# Altium project Carrier-Board-v1.0.PrjPcb (part 4 of 9)

## Sheet USB3.0_INTERFACE.SchDoc
size A4; SheetNumber: 7; SheetTotal: 20
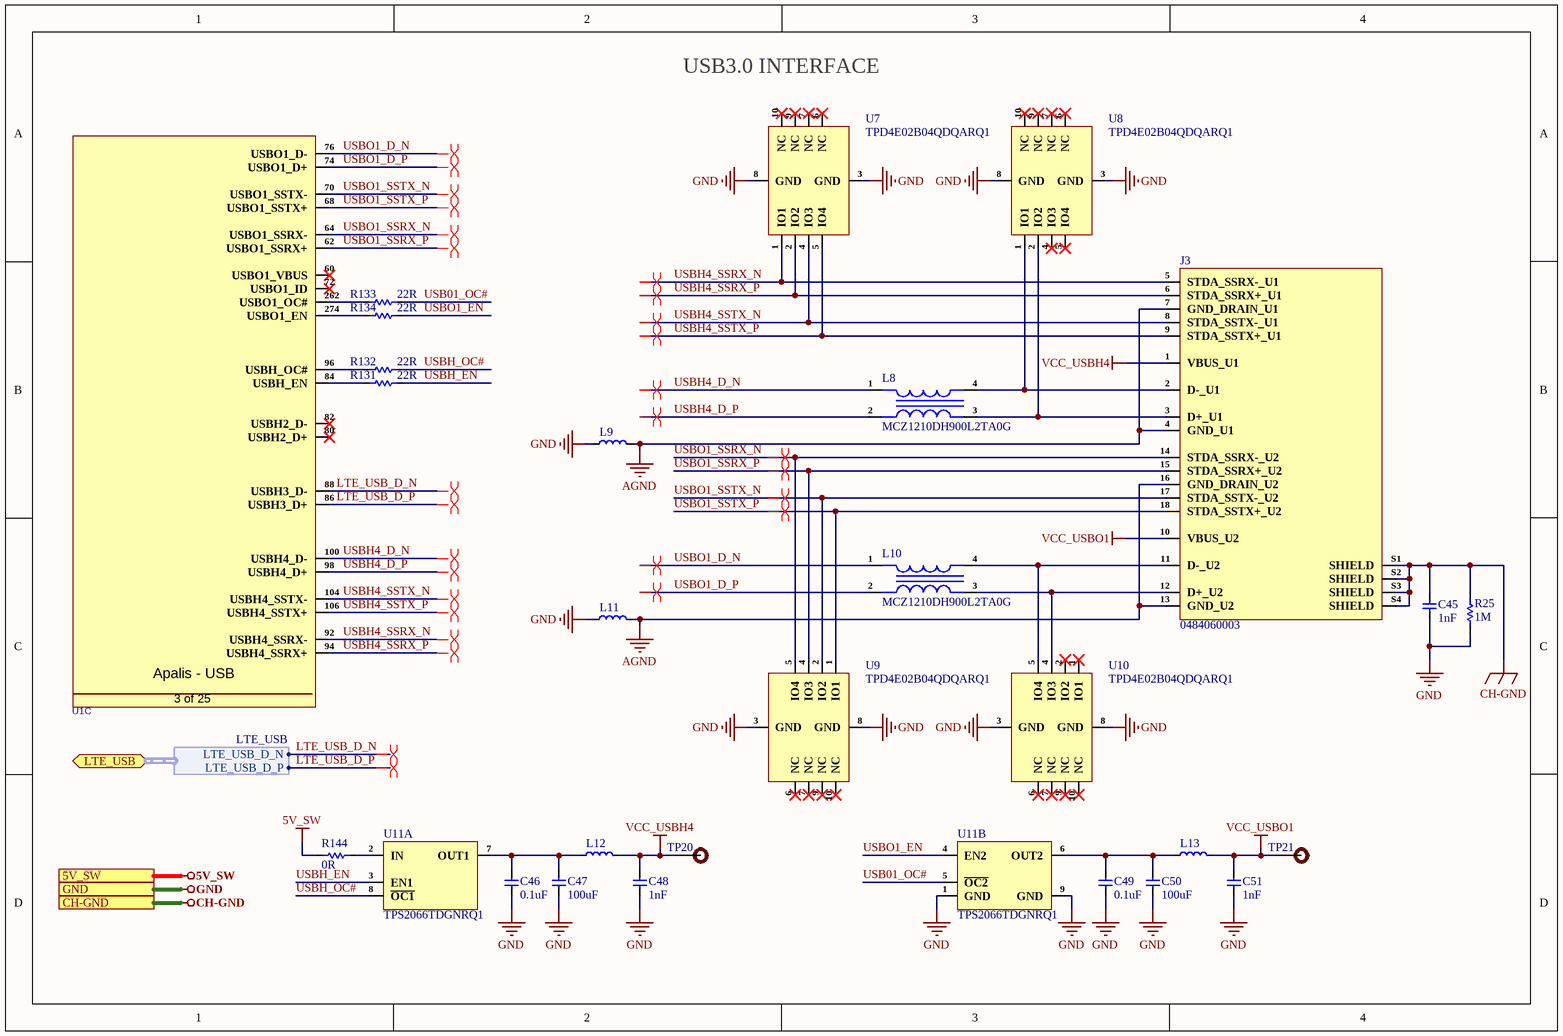
[diagram p6: USB3.0_INTERFACE.SchDoc]

### Parts
C45  1nF  [Cap-1206]
C46  0.1uF  [Cap-0402]
C47  100uF  [Cap-1210]
C48  1nF  [Cap-0402]
C49  0.1uF  [Cap-0402]
C50  100uF  [Cap-1210]
C51  1nF  [Cap-0402]
J3  0484060003  [0484060003]
L8  MCZ1210DH900L2TA0G  [MCZ1210DH900L2TA0G]
L9  BLM18EG221TN1D  [IND-0603 (1608 Metric)]  (value not drawn)
L10  MCZ1210DH900L2TA0G  [MCZ1210DH900L2TA0G]
L11  BLM18EG221TN1D  [IND-0603 (1608 Metric)]  (value not drawn)
L12  BLM18EG221TN1D  [IND-0603 (1608 Metric)]  (value not drawn)
L13  BLM18EG221TN1D  [IND-0603 (1608 Metric)]  (value not drawn)
R25  1M  [Res-0402]
R131  22R  [Res-0402]
R132  22R  [Res-0402]
R133  22R  [Res-0402]
R134  22R  [Res-0402]
R144  0R  [Res-1206]
TP20  DNP  [Test-point]  (value not drawn)
TP21  DNP  [Test-point]  (value not drawn)
U1  MM70-314B1-2-R300  [MM70-314B1-2-R300]  (value not drawn)  (part C of 25)
U7  TPD4E02B04QDQARQ1  [10-USON (2.5x1)]
U8  TPD4E02B04QDQARQ1  [10-USON (2.5x1)]
U9  TPD4E02B04QDQARQ1  [10-USON (2.5x1)]
U10  TPD4E02B04QDQARQ1  [10-USON (2.5x1)]
U11  TPS2066TDGNRQ1  [8-HVSSOP]  (parts A,B of 2)

### Ports
5V_SW (see Top_Sheet[1C], APALIS_POWER_SUPPLY[1D], CODEC_INTERFACE[1D], FUTURE_USE_CONNECTOR[1D], HDMI_INTERFACE[1D], LTE_MODULE[1D]), CH-GND (see Top_Sheet[1C], ETHERNET_INTERFACE[1D], HDMI_INTERFACE[1D], LTE_MODULE[1D], MECHANICAL_FOR_PCB[1D]), GND (see Top_Sheet[1C], 03-CAN2_SPI_CAN_CONTROLLER[1D], APALIS_POWER_SUPPLY[1D], CAN2_SPI_CAN_CONTROLLER[1D], CODEC_INTERFACE[1D], CONNECTORS[1D], DC_DC_CONVERTER[1D], DIGITAL_I-O_O-P[1D], ETHERNET_INTERFACE[1D], FUTURE_USE_CONNECTOR[1D], GPIO_NC_INTERFACE[4B], HDMI_INTERFACE[1D], I2C_INTERFACE[1B], INPUT_SUPPLY_PROTECTION[1D], LTE_MODULE[1D], MECHANICAL_FOR_PCB[1D], MICRO_SD_CARD_INTERFACE[1D], Reset_and_SDIO[1D], UART_INTERFACE[1D]), LTE_USB (bidir, harness LTE_USB, see Top_Sheet[1C], LTE_MODULE[2D])

### Harnesses
LTE_USB: LTE_USB_D_N, LTE_USB_D_P

### Nets
5V_SW: R144.1 ; port 5V_SW
AGND: J3.4(GND_U1) J3.7(GND_DRAIN_U1) J3.13(GND_U2) J3.16(GND_DRAIN_U2) L9.2 L11.2
CH-GND: C45.2 J3.S1(SHIELD) J3.S2(SHIELD) J3.S3(SHIELD) J3.S4(SHIELD) R25.2 ; port CH-GND
GND: C45.1 C46.1 C47.1 C48.1 C49.1 C50.1 C51.1 L9.1 L11.1 R25.1 U7.3(GND) U7.8(GND) U8.3(GND) U8.8(GND) U9.3(GND) U9.8(GND) U10.3(GND) U10.8(GND) U11.1(GND) U11.9(GND) ; port GND
VCC_USBH4: C48.2 J3.1(VBUS_U1) L12.2 TP20.1
VCC_USBO1: C51.2 J3.10(VBUS_U2) L13.2 TP21.1
LTE_USB_D_N: U1.88(USBH3_D-) ; port LTE_USB.LTE_USB_D_N  [project net LTE_USB.LTE_USB_D_N]
LTE_USB_D_P: U1.86(USBH3_D+) ; port LTE_USB.LTE_USB_D_P  [project net LTE_USB.LTE_USB_D_P]
USB01_OC#: R133.2 U11.5(~{OC2})
USBH4_D_N: L8.1 U1.100(USBH4_D-)
USBH4_D_P: L8.2 U1.98(USBH4_D+)
USBH4_SSRX_N: J3.5(STDA_SSRX-_U1) U1.92(USBH4_SSRX-) U7.1(IO1)
USBH4_SSRX_P: J3.6(STDA_SSRX+_U1) U1.94(USBH4_SSRX+) U7.2(IO2)
USBH4_SSTX_N: J3.8(STDA_SSTX-_U1) U1.104(USBH4_SSTX-) U7.4(IO3)
USBH4_SSTX_P: J3.9(STDA_SSTX+_U1) U1.106(USBH4_SSTX+) U7.5(IO4)
USBH_EN: R131.2 U11.3(EN1)
USBH_OC#: R132.2 U11.8(~{OC1})
USBO1_D_N: L10.1 U1.76(USBO1_D-)
USBO1_D_P: L10.2 U1.74(USBO1_D+)
USBO1_EN: R134.2 U11.4(EN2)
USBO1_SSRX_N: J3.14(STDA_SSRX-_U2) U1.64(USBO1_SSRX-) U9.5(IO4)
USBO1_SSRX_P: J3.15(STDA_SSRX+_U2) U1.62(USBO1_SSRX+) U9.4(IO3)
USBO1_SSTX_N: J3.17(STDA_SSTX-_U2) U1.70(USBO1_SSTX-) U9.2(IO2)
USBO1_SSTX_P: J3.18(STDA_SSTX+_U2) U1.68(USBO1_SSTX+) U9.1(IO1)
NetC46_2: C46.2 C47.2 L12.1 U11.7(OUT1)
NetC49_2: C49.2 C50.2 L13.1 U11.6(OUT2)
NetJ3_2: J3.2(D-_U1) L8.4 U8.1(IO1)
NetJ3_3: J3.3(D+_U1) L8.3 U8.2(IO2)
NetJ3_11: J3.11(D-_U2) L10.4 U10.5(IO4)
NetJ3_12: J3.12(D+_U2) L10.3 U10.4(IO3)
NetR131_1: R131.1 U1.84(USBH_EN)
NetR132_1: R132.1 U1.96(USBH_OC#)
NetR133_1: R133.1 U1.262(USBO1_OC#)
NetR134_1: R134.1 U1.274(USBO1_EN)
NetR144_2: R144.2 U11.2(IN)

Not connected (* = marked no-connect by the designer): U1 60(USBO1_VBUS)* 72(USBO1_ID)* 80(USBH2_D+)* 82(USBH2_D-)*; U7 6(NC)* 7(NC)* 9(NC)* 10(NC)*; U8 4(IO3)* 5(IO4)* 6(NC)* 7(NC)* 9(NC)* 10(NC)*; U9 6(NC)* 7(NC)* 9(NC)* 10(NC)*; U10 1(IO1)* 2(IO2)* 6(NC)* 7(NC)* 9(NC)* 10(NC)*

### Layout directives
differential pair; differential pair class LTE USB; rule Matched Net Lengths [Tolerance = 0.508mm]; rule Impedance Constraint [Min = 115.0    Max = 125.0    ]: LTE_USB.LTE_USB_D_N, LTE_USB.LTE_USB_D_P, USBH4_D_N, USBH4_D_P, USBH4_SSRX_N, USBH4_SSRX_P, USBH4_SSTX_N, USBH4_SSTX_P, USBO1_D_N, USBO1_D_P, USBO1_SSRX_N, USBO1_SSRX_P, USBO1_SSTX_N, USBO1_SSTX_P

### Notes on the sheet
- (near U7) USB3.0 INTERFACE
- (in symbol MM70-314B1-2-R300, part C) Apalis - USB; 3 of 25

### Library data of the parts
C45 = C1206C102KGRACAUTO: as C34 on sheet ETHERNET_INTERFACE; Supplier: Mouser; Supplier Part Number: 80-C1206C102KGRAUTO; Manufacturer Part Number: C1206C102KGRACAUTO; RoHS: No; Category: Ceramic Capacitors; Stock: 90441; Pricing: 1=0.26, 10=0.119, 50=0.119, 100=0.072, 1000=0.063, 10000=0.052 (USD); Mounting Technology: Surface Mount; Case/Package: 1206; Case Code (Metric): 3216; Case Code (Imperial): 1206; Contact Plating: Tin,Matte; Min Operating Temperature: -55°C; Max Operating Temperature: 125°C; Voltage Rating: 2kV; Packaging: Cut Tape; Value: 1nF; Dielectric: X7R; Termination: SMD/SMT; Voltage Rating (DC): 2kV; Series: SMD Auto X7R HV; Construction: Flat; Length: 3.2mm; Ratings: AEC-Q200; Reach SVHC Compliant: No; RoHS Compliant: No; ComponentLink1URL: http://www.farnell.com/datasheets/2741171.pdf?src-supplier=Farnell; ComponentLink1Description: http://www.farnell.com/datasheets/2741171.pdf?src-supplier=Farnell; ComponentLink2URL: http://www.mouser.com/ds/2/212/KEM_C1010_X7R_HV_SMD-1102742.pdf?src-supplier=Mouser; ComponentLink2Description: http://www.mouser.com/ds/2/212/KEM_C1010_X7R_HV_SMD-1102742.pdf?src-supplier=Mouser; ComponentLink3URL: http://capacitoredge.kemet.com/capedge2/DataSheet/Datasheet-C1206C102KGRACAUTO.pdf?pn=C1206C102KGRACAUTO&src-supplier=Avnet; ComponentLink3Description: http://capacitoredge.kemet.com/capedge2/DataSheet/Datasheet-C1206C102KGRACAUTO.pdf?pn=C1206C102KGRACAUTO&src-supplier=Avnet; ComponentLink4URL: http://www.farnell.com/datasheets/2741171.pdf?src-supplier=Newark; ComponentLink4Description: http://www.farnell.com/datasheets/2741171.pdf?src-supplier=Newark; ComponentLink5URL: https://datasheet.octopart.com/C1206C102KGRACAUTO-Kemet-datasheet-41767101.pdf?src-supplier=Newark; ComponentLink5Description: https://datasheet.octopart.com/C1206C102KGRACAUTO-Kemet-datasheet-41767101.pdf?src-supplier=Newark; ComponentLink6URL: https://api.kemet.com/component-edge/download/datasheet/C1206C102KGRACAUTO.pdf?src-supplier=Digi-Key; ComponentLink6Description: https://api.kemet.com/component-edge/download/datasheet/C1206C102KGRACAUTO.pdf?src-supplier=Digi-Key; ComponentLink7URL: https://datasheet.octopart.com/C1206C102KGRACAUTO-KEMET-datasheet-149525142.pdf?src-supplier=Farnell; ComponentLink7Description: https://datasheet.octopart.com/C1206C102KGRACAUTO-KEMET-datasheet-149525142.pdf?src-supplier=Farnell; ComponentLink8URL: http://www.farnell.com/datasheets/2741171.pdf?src-supplier=Element14; ComponentLink8Description: http://www.farnell.com/datasheets/2741171.pdf?src-supplier=Element14; ComponentLink9URL: https://datasheet.octopart.com/C1206C102KGRACAUTO-Kemet-datasheet-66532414.pdf?src-supplier=Element14; ComponentLink9Description: https://datasheet.octopart.com/C1206C102KGRACAUTO-Kemet-datasheet-66532414.pdf?src-supplier=Element14; ComponentLink10URL: https://datasheet.octopart.com/C1206C102KGRACAUTO-KEMET-datasheet-140424778.pdf?src-supplier=TME; ComponentLink10Description: https://datasheet.octopart.com/C1206C102KGRACAUTO-KEMET-datasheet-140424778.pdf?src-supplier=TME; ComponentLink11URL: https://datasheet.octopart.com/C1206C102KGRACAUTO-KEMET-datasheet-147336163.pdf?src-supplier=LKR; ComponentLink11Description: https://datasheet.octopart.com/C1206C102KGRACAUTO-KEMET-datasheet-147336163.pdf?src-supplier=LKR
C46 C49 = C0402C104K4REC7867: as C7 on sheet APALIS_POWER_SUPPLY; Supplier: Digi-Key; Supplier Part Number: 399-C0402C104K4REC7867CT-ND; Manufacturer Part Number: C0402C104K4REC7867; RoHS: No; Category: Ceramic Capacitors; Stock: 10918; Pricing: 1=0.1, 10=0.072, 50=0.0408, 100=0.0338, 500=0.02372, 1000=0.01963, 2500=0.01827, 5000=0.01672 (USD)
C47 C50 = C3225X7T1A107M250AC: CAP CER 100UF 10V X7T 1210; Manufacturer: TDK; Supplier: Digi-Key; Supplier Part Number: 445-C3225X7T1A107M250ACCT-ND; Manufacturer Part Number: C3225X7T1A107M250AC; RoHS: Yes; Category: Ceramic Capacitors; Stock: 654; Pricing: 1=1.75, 10=1.385, 50=1.2004, 100=1.0388, 500=0.78484 (USD)
C48 C51 = C0402S102K5RAC7867: CAP CER 1000PF 50V X7R 0402; Manufacturer: KEMET; Item Type: Capacitor; Supplier: Mouser; Supplier Part Number: 80-C0402S102K5R7867; Manufacturer Part Number: C0402S102K5RAC7867; RoHS: Yes; Stock: 17394; Pricing: 1=0.43, 10=0.208, 50=0.208, 100=0.156, 1000=0.113, 10000=0.092 (USD); RoHS Compliant: Yes; ComponentLink1URL: https://api.kemet.com/component-edge/download/datasheet/C0402S102K5RAC7867.pdf?src-supplier=Digi-Key; ComponentLink1Description: https://api.kemet.com/component-edge/download/datasheet/C0402S102K5RAC7867.pdf?src-supplier=Digi-Key
J3 = 0484060003: CONN RCPT USB3.0 TYPEA STACK R/A; Manufacturer: Molex; Supplier: Mouser; Supplier Part Number: 538-48406-0003; Manufacturer Part Number: 0484060003; RoHS: Yes; Stock: 6983; Pricing: 1=2.63, 10=2.32, 50=2.32, 100=1.84, 1000=1.79, 10000=1.36 (USD); ComponentLink1URL: https://datasheet.octopart.com/48406-0003-Molex-datasheet-101583044.pdf?src-supplier=Farnell; ComponentLink1Description: https://datasheet.octopart.com/48406-0003-Molex-datasheet-101583044.pdf?src-supplier=Farnell; ComponentLink2URL: https://www.molex.com/pdm_docs/sd/484060003_sd.pdf?src-supplier=Digi-Key; ComponentLink2Description: https://www.molex.com/pdm_docs/sd/484060003_sd.pdf?src-supplier=Digi-Key; ComponentLink3URL: https://datasheet.octopart.com/48406-0003-Molex-datasheet-33003502.pdf?src-supplier=Newark; ComponentLink3Description: https://datasheet.octopart.com/48406-0003-Molex-datasheet-33003502.pdf?src-supplier=Newark; ComponentLink4URL: https://datasheet.octopart.com/48406-0003-Molex-datasheet-21137617.pdf?src-supplier=Sager+Electronics; ComponentLink4Description: https://datasheet.octopart.com/48406-0003-Molex-datasheet-21137617.pdf?src-supplier=Sager+Electronics; ComponentLink5URL: https://datasheet.octopart.com/484060003-Molex-datasheet-168216735.pdf?src-supplier=TME; ComponentLink5Description: https://datasheet.octopart.com/484060003-Molex-datasheet-168216735.pdf?src-supplier=TME; ComponentLink6URL: https://datasheet.octopart.com/48406-0003-Molex-datasheet-154752298.pdf?src-supplier=Master+Electronics; ComponentLink6Description: https://datasheet.octopart.com/48406-0003-Molex-datasheet-154752298.pdf?src-supplier=Master+Electronics
L8 L10 = MCZ1210DH900L2TA0G: CMC 100MA 2LN 90 OHM SMD; Manufacturer: TDK; Supplier: Mouser; Supplier Part Number: 810-MCZ1210DH900L2TG; Manufacturer Part Number: MCZ1210DH900L2TA0G; RoHS: Yes; Category: Common Mode Chokes; Stock: 11260; Pricing: 1=0.58, 10=0.372, 50=0.372, 100=0.297, 1000=0.231, 10000=0.231 (USD); ComponentLink1URL: https://media.digikey.com/pdf/Data%20Sheets/TDK%20PDFs/MCZ_Series_Br.pdf?src-supplier=Digi-Key; ComponentLink1Description: https://media.digikey.com/pdf/Data%20Sheets/TDK%20PDFs/MCZ_Series_Br.pdf?src-supplier=Digi-Key; ComponentLink2URL: https://product.tdk.com/info/en/catalog/datasheets/cmf_commercial_signal_mcz1210dh_en.pdf?src-supplier=Digi-Key; ComponentLink2Description: https://product.tdk.com/info/en/catalog/datasheets/cmf_commercial_signal_mcz1210dh_en.pdf?src-supplier=Digi-Key
L9 L11-L13 = BLM18EG221TN1D: as L7 on sheet ETHERNET_INTERFACE; Supplier: Avnet; Supplier Part Number: BLM18EG221TN1D; Manufacturer Part Number: BLM18EG221TN1D; RoHS: Yes; Category: Ferrite Beads and Chips; Stock: 4000; Pricing: 4000=0.07735, 8000=0.07553, 16000=0.07371, 24000=0.07189, 32000=0.07007 (USD); ComponentLink1URL: https://datasheet.ciiva.com/11795/0900766b811b5866-11795384.pdf?src-supplier=Rs; ComponentLink1Description: https://datasheet.ciiva.com/11795/0900766b811b5866-11795384.pdf?src-supplier=Rs; ComponentLink2URL: https://datasheet.ciiva.com/41449/001172266-da-01-en-drossel-0603-220r-1-6x0-8mm-4000st-41449580.pdf?src-supplier=Conrad; ComponentLink2Description: https://datasheet.ciiva.com/41449/001172266-da-01-en-drossel-0603-220r-1-6x0-8mm-4000st-41449580.pdf?src-supplier=Conrad; ComponentLink3URL: https://datasheet.ciiva.com/1467/5169-1467159.pdf?src-supplier=Element14; ComponentLink3Description: https://datasheet.ciiva.com/1467/5169-1467159.pdf?src-supplier=Element14; ComponentLink4URL: https://datasheet.ciiva.com/1467/5169-1467160.pdf?src-supplier=Element14; ComponentLink4Description: https://datasheet.ciiva.com/1467/5169-1467160.pdf?src-supplier=Element14; ComponentLink5URL: https://datasheet.ciiva.com/8510/l0110s0101blm18e-8510167.pdf?src-supplier=Avnet; ComponentLink5Description: https://datasheet.ciiva.com/8510/l0110s0101blm18e-8510167.pdf?src-supplier=Avnet; ComponentLink6URL: https://datasheet.ciiva.com/16419/l0110s0101blm18e-16419150.pdf?src-supplier=Future+Electronics; ComponentLink6Description: https://datasheet.ciiva.com/16419/l0110s0101blm18e-16419150.pdf?src-supplier=Future+Electronics; ComponentLink7URL: https://datasheet.ciiva.com/6211/l0110s0101blm18e-6211853.pdf?src-supplier=Digi-Key; ComponentLink7Description: https://datasheet.ciiva.com/6211/l0110s0101blm18e-6211853.pdf?src-supplier=Digi-Key
R25 = CRGCQ0402J1M0: as R17 on sheet ETHERNET_INTERFACE; Supplier: Arrow Electronics; Supplier Part Number: CRGCQ0402J1M0; Manufacturer Part Number: CRGCQ0402J1M0; RoHS: Yes; Category: Chip SMD Resistors; Stock: 50000; Pricing: 20000=0.0015 (USD); Case/Package: 0402; Case Code (Imperial): 0402; Case Code (Metric): 1005; Min Operating Temperature: -55°C; Max Operating Temperature: 155°C; Features: Moisture Resistant,Automotive AEC-Q200; Packaging: Cut Tape; Tolerance: 5%; Number of Terminations: 2; Series: CRGCQ; Voltage Rating (DC): 50V; Height: 400um; Ratings: AEC-Q200; RoHS Compliant: Yes; ComponentLink1URL: http://datasheet.octopart.com/CRGCQ0402J1M0-TE-Connectivity-datasheet-114679081.pdf?src-supplier=Mouser; ComponentLink1Description: http://datasheet.octopart.com/CRGCQ0402J1M0-TE-Connectivity-datasheet-114679081.pdf?src-supplier=Mouser; ComponentLink2URL: http://datasheet.octopart.com/CRGCQ0402J1M0-TE-Connectivity-datasheet-114679081.pdf?src-supplier=Arrow+Electronics; ComponentLink2Description: http://datasheet.octopart.com/CRGCQ0402J1M0-TE-Connectivity-datasheet-114679081.pdf?src-supplier=Arrow+Electronics; ComponentLink3URL: http://datasheet.octopart.com/CRGCQ0402J1M0-TE-Connectivity-datasheet-114679081.pdf?src-supplier=Onlinecomponents.com; ComponentLink3Description: http://datasheet.octopart.com/CRGCQ0402J1M0-TE-Connectivity-datasheet-114679081.pdf?src-supplier=Onlinecomponents.com; ComponentLink4URL: http://datasheet.octopart.com/CRGCQ0402J1M0-TE-Connectivity-datasheet-114679081.pdf?src-supplier=Digi-Key; ComponentLink4Description: http://datasheet.octopart.com/CRGCQ0402J1M0-TE-Connectivity-datasheet-114679081.pdf?src-supplier=Digi-Key; ComponentLink5URL: http://datasheet.octopart.com/CRGCQ0402J1M0-TE-Connectivity-datasheet-114679081.pdf?src-supplier=Verical; ComponentLink5Description: http://datasheet.octopart.com/CRGCQ0402J1M0-TE-Connectivity-datasheet-114679081.pdf?src-supplier=Verical; ComponentLink6URL: https://www.te.com/commerce/DocumentDelivery/DDEController?Action=srchrtrv&DocNm=1773204-3&DocType=DS&DocLang=English&src-supplier=Digi-Key; ComponentLink6Description: https://www.te.com/commerce/DocumentDelivery/DDEController?Action=srchrtrv&DocNm=1773204-3&DocType=DS&DocLang=English&src-supplier=Digi-Key; ComponentLink7URL: http://datasheet.octopart.com/CRGCQ0402J1M0-TE-Connectivity-datasheet-114679081.pdf?src-supplier=Newark; ComponentLink7Description: http://datasheet.octopart.com/CRGCQ0402J1M0-TE-Connectivity-datasheet-114679081.pdf?src-supplier=Newark; ComponentLink8URL: http://datasheet.octopart.com/CRGCQ0402J1M0-TE-Connectivity-datasheet-114679081.pdf?src-supplier=Avnet; ComponentLink8Description: http://datasheet.octopart.com/CRGCQ0402J1M0-TE-Connectivity-datasheet-114679081.pdf?src-supplier=Avnet; ComponentLink9URL: http://datasheet.octopart.com/CRGCQ0402J1M0-TE-Connectivity-datasheet-114679081.pdf?src-supplier=Farnell; ComponentLink9Description: http://datasheet.octopart.com/CRGCQ0402J1M0-TE-Connectivity-datasheet-114679081.pdf?src-supplier=Farnell; ComponentLink10URL: http://datasheet.octopart.com/CRGCQ0402J1M0-TE-Connectivity-datasheet-114679081.pdf?src-supplier=Sager+Electronics; ComponentLink10Description: http://datasheet.octopart.com/CRGCQ0402J1M0-TE-Connectivity-datasheet-114679081.pdf?src-supplier=Sager+Electronics; ComponentLink11URL: http://datasheet.octopart.com/CRGCQ0402J1M0-TE-Connectivity-datasheet-114679081.pdf?src-supplier=TME; ComponentLink11Description: http://datasheet.octopart.com/CRGCQ0402J1M0-TE-Connectivity-datasheet-114679081.pdf?src-supplier=TME; ComponentLink12URL: http://datasheet.octopart.com/CRGCQ0402J1M0-TE-Connectivity-datasheet-114679081.pdf?src-supplier=Electro+Sonic; ComponentLink12Description: http://datasheet.octopart.com/CRGCQ0402J1M0-TE-Connectivity-datasheet-114679081.pdf?src-supplier=Electro+Sonic; ComponentLink13URL: http://datasheet.octopart.com/CRGCQ0402J1M0-TE-Connectivity-datasheet-114679081.pdf?src-supplier=Interstate+Connecting+Components; ComponentLink13Description: http://datasheet.octopart.com/CRGCQ0402J1M0-TE-Connectivity-datasheet-114679081.pdf?src-supplier=Interstate+Connecting+Components; ComponentLink14URL: http://datasheet.octopart.com/CRGCQ0402J1M0-TE-Connectivity-datasheet-114679081.pdf?src-supplier=Heilind+Electronics; ComponentLink14Description: http://datasheet.octopart.com/CRGCQ0402J1M0-TE-Connectivity-datasheet-114679081.pdf?src-supplier=Heilind+Electronics; ComponentLink15URL: https://datasheet.octopart.com/CRGCQ0402J1M0-TE-Connectivity-datasheet-114679081.pdf?src-supplier=Master+Electronics; ComponentLink15Description: https://datasheet.octopart.com/CRGCQ0402J1M0-TE-Connectivity-datasheet-114679081.pdf?src-supplier=Master+Electronics
R131-R134 = CRGCQ0402J22R: as R116 on sheet 03-CAN2_SPI_CAN_CONTROLLER; Supplier: Avnet; Supplier Part Number: 73AC8982; Manufacturer Part Number: CRGCQ0402J22R; RoHS: Yes; Category: Chip SMD Resistors; Stock: 20000; Pricing: 1=0.036, 25=0.01, 100=0.008, 250=0.006, 500=0.005 (USD); ComponentLink1URL: https://www.te.com/commerce/DocumentDelivery/DDEController?Action=srchrtrv&amp;DocNm=1773204-3&amp;DocType=DS&amp;DocLang=English&src-supplier=Digi-Key; ComponentLink1Description: https://www.te.com/commerce/DocumentDelivery/DDEController?Action=srchrtrv&amp;DocNm=1773204-3&amp;DocType=DS&amp;DocLang=English&src-supplier=Digi-Key; ComponentLink2URL: https://4donline.ihs.com/images/VipMasterIC/IC/TYEL/TYEL-S-A0004929575/TYEL-S-A0004929575-1.pdf?hkey=52A5661711E402568146F3353EA87419&src-supplier=Newark; ComponentLink2Description: https://4donline.ihs.com/images/VipMasterIC/IC/TYEL/TYEL-S-A0004929575/TYEL-S-A0004929575-1.pdf?hkey=52A5661711E402568146F3353EA87419&src-supplier=Newark; ComponentLink3URL: https://4donline.ihs.com/images/VipMasterIC/IC/TYEL/TYEL-S-A0004929575/TYEL-S-A0004929575-1.pdf?hkey=52A5661711E402568146F3353EA87419&src-supplier=Element14; ComponentLink3Description: https://4donline.ihs.com/images/VipMasterIC/IC/TYEL/TYEL-S-A0004929575/TYEL-S-A0004929575-1.pdf?hkey=52A5661711E402568146F3353EA87419&src-supplier=Element14; ComponentLink4URL: https://datasheet.octopart.com/CRGCQ0402J22R-TE-Connectivity-datasheet-114679081.pdf?src-supplier=Master+Electronics; ComponentLink4Description: https://datasheet.octopart.com/CRGCQ0402J22R-TE-Connectivity-datasheet-114679081.pdf?src-supplier=Master+Electronics
R144 = RC1206JR-070RL: as R147 on sheet APALIS_POWER_SUPPLY; Supplier: Future Electronics; Supplier Part Number: 1070203; Manufacturer Part Number: RC1206JR-070RL; RoHS: Yes; Category: Chip SMD Resistors; Stock: 615000; Pricing: 5000=0.0047, 25000=0.0045, 100000=0.0042, 250000=0.0041, 625000=0.0038 (USD); Case/Package: 1206; Contact Plating: Tin,Matte; Case Code (Metric): 3216; Case Code (Imperial): 1206; Min Operating Temperature: -55°C; Max Operating Temperature: 155°C; Resistor Type: Thick Film,Carbon Film; Packaging: Tape and Reel; Package Quantity: 1; Number of Terminations: 2; Termination: SMD/SMT; Max Power Dissipation: 250mW; Series: RC; Resistance Tolerance: 5%; Technology: THICK FILM; Features: Moisture Resistant; Voltage Rating (AC): 200V; Length: 0.122inch; Width: 0.063inch; Height: 0.026inch; Depth: 1.6mm; Lead Free: Lead Free; RoHS Compliant: Yes; Reach SVHC Compliant: Unknown; ComponentLink1URL: https://datasheet.ciiva.com/11808/0900766b80c6630a-11808156.pdf?src-supplier=Rs; ComponentLink1Description: https://datasheet.ciiva.com/11808/0900766b80c6630a-11808156.pdf?src-supplier=Rs; ComponentLink2URL: https://datasheet.ciiva.com/29181/402222-da-01-en-smd-widerstand-0-ohm-1206-29181568.pdf?src-supplier=Conrad; ComponentLink2Description: https://datasheet.ciiva.com/29181/402222-da-01-en-smd-widerstand-0-ohm-1206-29181568.pdf?src-supplier=Conrad; ComponentLink3URL: https://datasheet.ciiva.com/7983/444357-7983807.pdf?src-supplier=Element14; ComponentLink3Description: https://datasheet.ciiva.com/7983/444357-7983807.pdf?src-supplier=Element14; ComponentLink4URL: https://datasheet.ciiva.com/22747/1692832-22747541.pdf?src-supplier=Element14; ComponentLink4Description: https://datasheet.ciiva.com/22747/1692832-22747541.pdf?src-supplier=Element14; ComponentLink5URL: https://datasheet.ciiva.com/46445/444357-46445719.pdf?src-supplier=Element14; ComponentLink5Description: https://datasheet.ciiva.com/46445/444357-46445719.pdf?src-supplier=Element14; ComponentLink6URL: https://datasheet.ciiva.com/2458/pyu-rc1206-51-rohs-l-4-2458669.pdf?src-supplier=Digi-Key; ComponentLink6Description: https://datasheet.ciiva.com/2458/pyu-rc1206-51-rohs-l-4-2458669.pdf?src-supplier=Digi-Key; ComponentLink7URL: https://datasheet.ciiva.com/2458/pyu-rc1206-51-rohs-l-4-2458670.pdf?src-supplier=Digi-Key; ComponentLink7Description: https://datasheet.ciiva.com/2458/pyu-rc1206-51-rohs-l-4-2458670.pdf?src-supplier=Digi-Key; ComponentLink8URL: https://datasheet.ciiva.com/2458/pyu-rc1206-51-rohs-l-4-2458668.pdf?src-supplier=Digi-Key; ComponentLink8Description: https://datasheet.ciiva.com/2458/pyu-rc1206-51-rohs-l-4-2458668.pdf?src-supplier=Digi-Key; ComponentLink9URL: https://datasheet.ciiva.com/7857/1692832-7857422.pdf?src-supplier=Element14; ComponentLink9Description: https://datasheet.ciiva.com/7857/1692832-7857422.pdf?src-supplier=Element14; ComponentLink10URL: https://datasheet.ciiva.com/7857/1692832-7857421.pdf?src-supplier=Element14; ComponentLink10Description: https://datasheet.ciiva.com/7857/1692832-7857421.pdf?src-supplier=Element14; ComponentLink11URL: https://datasheet.ciiva.com/17035/pyu-rc1206-51-rohs-l-4-17035512.pdf?src-supplier=Future+Electronics; ComponentLink11Description: https://datasheet.ciiva.com/17035/pyu-rc1206-51-rohs-l-4-17035512.pdf?src-supplier=Future+Electronics
TP20 TP21 = TEST POINT: Test Point ON; Item Type: TEST POINT
U1 = MM70-314B1-2-R300: as U1 on sheet APALIS_POWER_SUPPLY; Supplier: Digi-Key; Supplier Part Number: 670-MM70-314B1-2-R300CT-ND; Manufacturer Part Number: MM70-314B1-2-R300; RoHS: No; Category: Card Edge Connectors; Stock: 4979; Pricing: 1=9.21, 10=8.287, 25=7.8064, 50=7.6064, 100=7.4062 (USD)
U7-U10 = TPD4E02B04QDQARQ1: TVS DIODE 3.6VWM 8.8VC 10USON; Manufacturer: Texas Instruments; Interface: LVDS,USB,Ethernet,HDMI; Number of Channels: 4; Reverse Standoff Voltage: 3.6V; Min Breakdown Voltage: 5.5V; Peak Pulse Current: 2A; Peak Pulse Power: 17W; Power Line Protection: No; Diode Type: ZENER; Supplier: Mouser; Supplier Part Number: 595-D4E02B04QDQARQ1; Manufacturer Part Number: TPD4E02B04QDQARQ1; RoHS: Yes; Category: Integrated Circuits (ICs); Stock: 35915; Pricing: 1=0.63, 10=0.544, 50=0.544, 100=0.383, 1000=0.27, 10000=0.227 (USD); Mounting Technology: Surface Mount; Pins: 10; Min Operating Temperature: -40°C; Max Operating Temperature: 125°C; Packaging: Cut Tape; Number of Bidirectional Channels: 4; Series: Automotive, AEC-Q101; RoHS Compliant: Yes; ComponentLink1URL: http://www.ti.com/lit/ds/symlink/tpd4e02b04-q1.pdf?src-supplier=Digi-Key; ComponentLink1Description: http://www.ti.com/lit/ds/symlink/tpd4e02b04-q1.pdf?src-supplier=Digi-Key
U11 = TPS2066TDGNRQ1: IC PWR SWITCH N-CHAN 1:2 8MSOP; Manufacturer: Texas Instruments; Supplier: Mouser; Supplier Part Number: 595-TPS2066TDGNRQ1; Manufacturer Part Number: TPS2066TDGNRQ1; RoHS: Yes; Category: Hot Swap Controllers; Stock: 11970; Pricing: 1=1.82, 10=1.66, 50=1.66, 100=1.33, 1000=0.963, 10000=0.825 (USD); ComponentLink1URL: https://datasheet.ciiva.com/4924/slvsb37-121164-4924528.pdf?src-supplier=Mouser; ComponentLink1Description: https://datasheet.ciiva.com/4924/slvsb37-121164-4924528.pdf?src-supplier=Mouser; ComponentLink2URL: https://datasheet.ciiva.com/1963/slvsb37-1963712.pdf?src-supplier=Digi-Key; ComponentLink2Description: https://datasheet.ciiva.com/1963/slvsb37-1963712.pdf?src-supplier=Digi-Key; ComponentLink3URL: https://datasheet.ciiva.com/14207/tps2066-q1-14207125.pdf?src-supplier=Avnet; ComponentLink3Description: https://datasheet.ciiva.com/14207/tps2066-q1-14207125.pdf?src-supplier=Avnet

## Sheet MICRO_SD_CARD_INTERFACE.SchDoc
size A4; SheetNumber: 8; SheetTotal: 20
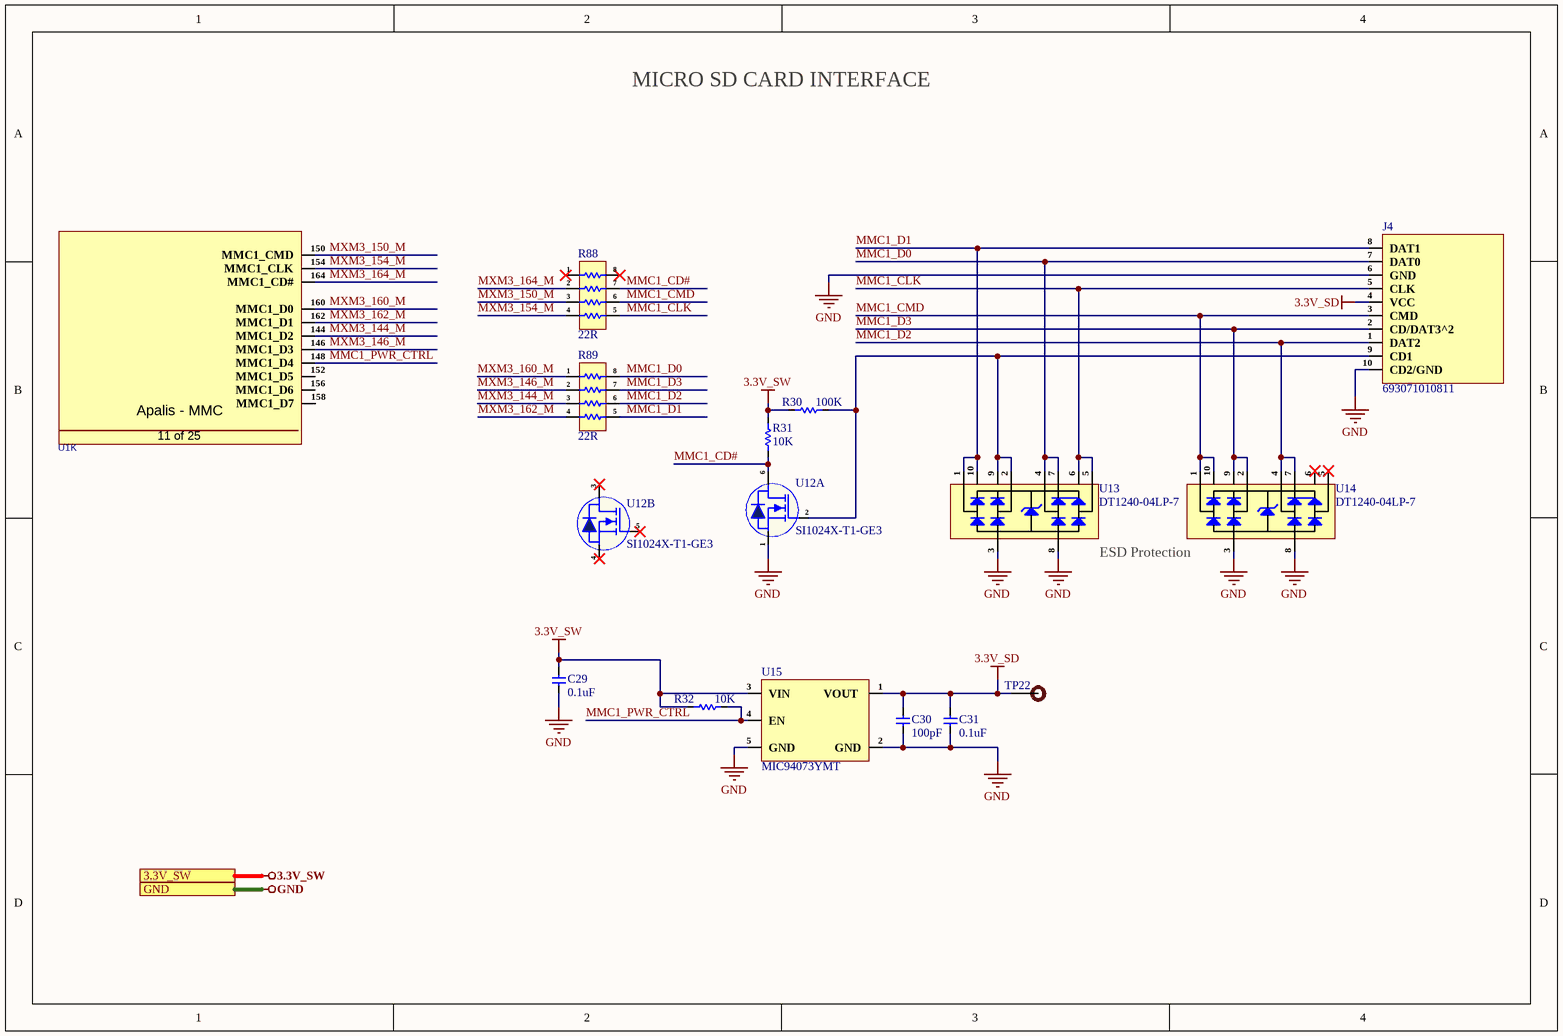
[diagram p7: MICRO_SD_CARD_INTERFACE.SchDoc]

### Parts
C29  0.1uF  [Cap-0402]
C30  100pF  [Cap-0603]
C31  0.1uF  [Cap-0402]
J4  693071010811  [693071010811]
R30  100K  [Res-0603]
R31  10K  [Res-0603]
R32  10K  [Res-0603]
R88  22R  [YC164-JR-0722RL]
R89  22R  [YC164-JR-0722RL]
TP22  DNP  [Test-point]  (value not drawn)
U1  MM70-314B1-2-R300  [MM70-314B1-2-R300]  (value not drawn)  (part K of 25)
U12  SI1024X-T1-GE3  [SC-89]  (parts A,B of 2)
U13  DT1240-04LP-7  [U-DFN2510-10]
U14  DT1240-04LP-7  [U-DFN2510-10]
U15  MIC94073YMT  [4-TMLF® (1.2x1.6)]

### Ports
3.3V_SW (see Top_Sheet[1D], DIGITAL_I-O_O-P[1D], ETHERNET_INTERFACE[1D], FUTURE_USE_CONNECTOR[1D], HDMI_INTERFACE[1D], I2C_INTERFACE[1B], UART_INTERFACE[1D]), GND (see Top_Sheet[1D], 03-CAN2_SPI_CAN_CONTROLLER[1D], APALIS_POWER_SUPPLY[1D], CAN2_SPI_CAN_CONTROLLER[1D], CODEC_INTERFACE[1D], CONNECTORS[1D], DC_DC_CONVERTER[1D], DIGITAL_I-O_O-P[1D], ETHERNET_INTERFACE[1D], FUTURE_USE_CONNECTOR[1D], GPIO_NC_INTERFACE[4B], HDMI_INTERFACE[1D], I2C_INTERFACE[1B], INPUT_SUPPLY_PROTECTION[1D], LTE_MODULE[1D], MECHANICAL_FOR_PCB[1D], Reset_and_SDIO[1D], UART_INTERFACE[1D], USB3.0_INTERFACE[1D])

### Nets
3.3V_SD: C30.2 C31.2 J4.4(VCC) TP22.1 U15.1(VOUT)
3.3V_SW: C29.2 R30.1 R31.2 R32.2 U15.3(VIN) ; port 3.3V_SW
GND: C29.1 C30.1 C31.1 J4.6(GND) J4.10(CD2/GND) U12.1(S1) U13.3 U13.8 U14.3 U14.8 U15.2(GND) U15.5(GND) ; port GND
MMC1_CD#: R31.1 R88.7 U12.6(D1)
MMC1_CLK: J4.5(CLK) R88.5 U13.5 U13.6
MMC1_CMD: J4.3(CMD) R88.6 U14.1 U14.10
MMC1_D0: J4.7(DAT0) R89.8 U13.4 U13.7
MMC1_D1: J4.8(DAT1) R89.5 U13.1 U13.10
MMC1_D2: J4.1(DAT2) R89.6 U14.4 U14.7
MMC1_D3: J4.2(CD/DAT3^2) R89.7 U14.2 U14.9
MMC1_PWR_CTRL: R32.1 U1.148(MMC1_D4) U15.4(EN)
MXM3_144_M: R89.3 U1.144(MMC1_D2)
MXM3_146_M: R89.2 U1.146(MMC1_D3)
MXM3_150_M: R88.3 U1.150(MMC1_CMD)
MXM3_154_M: R88.4 U1.154(MMC1_CLK)
MXM3_160_M: R89.1 U1.160(MMC1_D0)
MXM3_162_M: R89.4 U1.162(MMC1_D1)
MXM3_164_M: R88.2 U1.164(MMC1_CD#)
NetJ4_9: J4.9(CD1) R30.2 U12.2(G1) U13.2 U13.9

Not connected (* = marked no-connect by the designer): R88 1* 8*; U1 152(MMC1_D5) 156(MMC1_D6) 158(MMC1_D7); U12 3(D2)* 4(S2)* 5(G2)*; U14 5* 6*

### Notes on the sheet
- MICRO SD CARD INTERFACE
- ESD Protection
- (in symbol MM70-314B1-2-R300, part K) Apalis - MMC; 11 of 25

### Library data of the parts
C29 C31 = C0402C104K4REC7867: as C7 on sheet APALIS_POWER_SUPPLY; Supplier: Digi-Key; Supplier Part Number: 399-C0402C104K4REC7867CT-ND; Manufacturer Part Number: C0402C104K4REC7867; RoHS: No; Category: Ceramic Capacitors; Stock: 10918; Pricing: 1=0.1, 10=0.072, 50=0.0408, 100=0.0338, 500=0.02372, 1000=0.01963, 2500=0.01827, 5000=0.01672 (USD)
C30 = C1608NP01H101J080AA: CAP CER 100PF 50V NP0 0603; Manufacturer: TDK; Item Type: Capacitor; Supplier: Arrow Electronics; Supplier Part Number: C1608NP01H101J080AA; Manufacturer Part Number: C1608NP01H101J080AA; RoHS: Yes; Category: Ceramic Capacitors; Stock: 1236; Pricing: 1=0.1172, 10=0.0734, 25=0.0727, 50=0.0628, 100=0.0474, 250=0.0469, 500=0.0388, 1000=0.0313 (USD); ComponentLink1URL: http://www.mouser.com/ds/2/400/tdk_mlcc_commercial_general_en-542463.pdf?src-supplier=Mouser; ComponentLink1Description: http://www.mouser.com/ds/2/400/tdk_mlcc_commercial_general_en-542463.pdf?src-supplier=Mouser; ComponentLink2URL: https://datasheet.octopart.com/C1608NP01H101J080AA-TDK-datasheet-43914282.pdf?src-supplier=Future+Electronics; ComponentLink2Description: https://datasheet.octopart.com/C1608NP01H101J080AA-TDK-datasheet-43914282.pdf?src-supplier=Future+Electronics; ComponentLink3URL: https://product.tdk.com/info/en/catalog/datasheets/mlcc_commercial_hightemp_en.pdf?ref_disty=digikey&src-supplier=Digi-Key; ComponentLink3Description: https://product.tdk.com/info/en/catalog/datasheets/mlcc_commercial_hightemp_en.pdf?ref_disty=digikey&src-supplier=Digi-Key; ComponentLink4URL: https://product.tdk.com/info/en/documents/chara_sheet/C1608NP01H101J080AA.pdf?src-supplier=Digi-Key; ComponentLink4Description: https://product.tdk.com/info/en/documents/chara_sheet/C1608NP01H101J080AA.pdf?src-supplier=Digi-Key; ComponentLink5URL: http://product.tdk.com/en/catalog/datasheets/mlcc_commercial_hightemp_en.pdf?src-supplier=Avnet; ComponentLink5Description: http://product.tdk.com/en/catalog/datasheets/mlcc_commercial_hightemp_en.pdf?src-supplier=Avnet
J4 = 693071010811: CONN MICRO SD CARD PUSH-PUSH R/A; Manufacturer: Wurth Electronics; Number of Contacts: 8; Supplier: Rs; Supplier Part Number: 7636808P; Manufacturer Part Number: 693071010811; RoHS: Yes; Category: Memory Connectors; Stock: 1582; Pricing: 15=2.41, 50=2.12, 100=2.02, 250=1.74 (GBP); Mounting Technology: Surface Mount; Contact Material: Copper Alloy,Copper,Gold; Contact Plating: Gold; Min Operating Temperature: -25°C; Max Operating Temperature: 85°C; Package Quantity: 1; Packaging: Cut Tape; Series: -; Length: 14mm; Width: 15.2mm; Height: 1.98mm; RoHS Compliant: Yes; Reach SVHC Compliant: Unknown; Lead Free: Lead Free; ComponentLink1URL: https://datasheet.ciiva.com/6935/693071010811-6935152.pdf?src-supplier=Digi-Key; ComponentLink1Description: https://datasheet.ciiva.com/6935/693071010811-6935152.pdf?src-supplier=Digi-Key; ComponentLink2URL: https://datasheet.ciiva.com/25605/0900766b81113f2e-25605369.pdf?src-supplier=Rs; ComponentLink2Description: https://datasheet.ciiva.com/25605/0900766b81113f2e-25605369.pdf?src-supplier=Rs; ComponentLink3URL: https://datasheet.ciiva.com/1104/1759178-1104796.pdf?src-supplier=Element14; ComponentLink3Description: https://datasheet.ciiva.com/1104/1759178-1104796.pdf?src-supplier=Element14; ComponentLink4URL: https://datasheet.ciiva.com/6935/693071010811-6935146.pdf?src-supplier=Digi-Key; ComponentLink4Description: https://datasheet.ciiva.com/6935/693071010811-6935146.pdf?src-supplier=Digi-Key
R30 = RC0603FR-07100KL: RES 100K OHM 1% 1/10W 0603; Manufacturer: Yageo; Value: 100kR; Temperature Coefficient: 100ppm/°C; Voltage Rating (DC): 50V; Power Rating: 100mW; Supplier: Future Electronics; Supplier Part Number: 3697448; Manufacturer Part Number: RC0603FR-07100KL; RoHS: Yes; Category: Chip SMD Resistors; Stock: 11175000; Pricing: 5000=0.0013, 50000=0.0012, 75000=0.0014, 200000=0.0011, 250000=0.0014, 625000=0.0011, 750000=0.0013, 2000000=0.001, 2500000=0.0012 (USD); Case/Package: 0603; Pins: 2; Case Code (Imperial): 0603; Case Code (Metric): 1608; Min Operating Temperature: -55°C; Max Operating Temperature: 155°C; Tolerance: 1%; Resistor Type: Thick Film; Packaging: Tape and Reel; Voltage Rating: 50V; Termination: SMD/SMT; Number of Terminations: 2; Features: Moisture Resistant; Series: RC; Max Power Dissipation: 100mW; Resistance Tolerance: 1%; Construction: Rectangular; Technology: THICK FILM; Length: 1.6mm; Width: 0.8mm; Height: 0.45mm; Depth: 0.8mm; Reach SVHC Compliant: No; Lead Free: Lead Free; Military Standard: Not; RoHS Compliant: Yes
R31 R32 = RCA060310K0FKEAHP: as R126 on sheet APALIS_POWER_SUPPLY; Supplier: Future Electronics; Supplier Part Number: 4171415; Manufacturer Part Number: RCA060310K0FKEAHP; RoHS: Yes; Category: Chip SMD Resistors; Stock: 10000; Pricing: 5000=0.0413, 10000=0.0403, 15000=0.0397, 25000=0.0389, 50000=0.0374 (USD); Case/Package: 0603; Case Code (Imperial): 0603; Case Code (Metric): 1608; Min Operating Temperature: -55°C; Max Operating Temperature: 155°C; Features: Automotive AEC-Q200,Anti-Sulfur; Packaging: Cut Tape; Tolerance: 1%; Number of Terminations: 2; Series: RCA-HP; Ratings: AEC-Q200; RoHS Compliant: Yes; ComponentLink1URL: http://www.vishay.com/docs/20067/rcahp.pdf?src-supplier=Digi-Key; ComponentLink1Description: http://www.vishay.com/docs/20067/rcahp.pdf?src-supplier=Digi-Key
R88 R89 = YC164-JR-0722RL: as R90 on sheet HDMI_INTERFACE; Supplier: Future Electronics; Supplier Part Number: 4472155; Manufacturer Part Number: YC164-JR-0722RL; RoHS: Yes; Category: Resistor Arrays; Stock: 225000; Pricing: 5000=0.0084, 20000=0.008, 50000=0.0078, 125000=0.0075, 200000=0.0071 (USD); ComponentLink1URL: https://datasheet.ciiva.com/8018/443424-8018007.pdf?src-supplier=Element14; ComponentLink1Description: https://datasheet.ciiva.com/8018/443424-8018007.pdf?src-supplier=Element14; ComponentLink2URL: https://datasheet.ciiva.com/8018/443424-8018008.pdf?src-supplier=Element14; ComponentLink2Description: https://datasheet.ciiva.com/8018/443424-8018008.pdf?src-supplier=Element14; ComponentLink3URL: https://datasheet.ciiva.com/2688/pyu-yc-tc164-51-rohs-l-3-2688422.pdf?src-supplier=Digi-Key; ComponentLink3Description: https://datasheet.ciiva.com/2688/pyu-yc-tc164-51-rohs-l-3-2688422.pdf?src-supplier=Digi-Key; ComponentLink4URL: https://datasheet.ciiva.com/2688/pyu-yc-tc164-51-rohs-l-3-2688421.pdf?src-supplier=Digi-Key; ComponentLink4Description: https://datasheet.ciiva.com/2688/pyu-yc-tc164-51-rohs-l-3-2688421.pdf?src-supplier=Digi-Key; ComponentLink5URL: https://datasheet.ciiva.com/8320/pyu-yc-tc164-51-rohs-l-3-8320230.pdf?src-supplier=Avnet; ComponentLink5Description: https://datasheet.ciiva.com/8320/pyu-yc-tc164-51-rohs-l-3-8320230.pdf?src-supplier=Avnet; ComponentLink6URL: https://datasheet.ciiva.com/2688/pyu-yc-tc164-51-rohs-l-3-2688423.pdf?src-supplier=Digi-Key; ComponentLink6Description: https://datasheet.ciiva.com/2688/pyu-yc-tc164-51-rohs-l-3-2688423.pdf?src-supplier=Digi-Key; ComponentLink7URL: https://datasheet.ciiva.com/17030/pyu-yc-tc164-51-rohs-l-3-17030158.pdf?src-supplier=Future+Electronics; ComponentLink7Description: https://datasheet.ciiva.com/17030/pyu-yc-tc164-51-rohs-l-3-17030158.pdf?src-supplier=Future+Electronics; ComponentLink8URL: https://datasheet.ciiva.com/28379/pyu-yc-tc164-51-rohs-l-3-28379358.pdf?; ComponentLink8Description: https://datasheet.ciiva.com/28379/pyu-yc-tc164-51-rohs-l-3-28379358.pdf?
TP22 = TEST POINT: Test Point ON; Item Type: TEST POINT
U1 = MM70-314B1-2-R300: as U1 on sheet APALIS_POWER_SUPPLY; Supplier: Digi-Key; Supplier Part Number: 670-MM70-314B1-2-R300CT-ND; Manufacturer Part Number: MM70-314B1-2-R300; RoHS: No; Category: Card Edge Connectors; Stock: 4979; Pricing: 1=9.21, 10=8.287, 25=7.8064, 50=7.6064, 100=7.4062 (USD)
U12 = SI1024X-T1-GE3: MOSFET 2N-CH 20V 0.485A SC89-6; Manufacturer: Vishay Siliconix; Supplier: Mouser; Supplier Part Number: 781-SI1024X-T1-GE3; Manufacturer Part Number: SI1024X-T1-GE3; RoHS: Yes; Category: MOSFETs; Stock: 297800; Pricing: 1=0.52, 10=0.442, 50=0.442, 100=0.333, 1000=0.206, 10000=0.163 (USD); ComponentLink1URL: https://datasheet.ciiva.com/1253/71170-1253313.pdf?src-supplier=Newark; ComponentLink1Description: https://datasheet.ciiva.com/1253/71170-1253313.pdf?src-supplier=Newark; ComponentLink2URL: https://datasheet.ciiva.com/6388/71170-6388105.pdf?src-supplier=Digi-Key; ComponentLink2Description: https://datasheet.ciiva.com/6388/71170-6388105.pdf?src-supplier=Digi-Key; ComponentLink3URL: https://datasheet.ciiva.com/6388/71170-6388154.pdf?src-supplier=Digi-Key; ComponentLink3Description: https://datasheet.ciiva.com/6388/71170-6388154.pdf?src-supplier=Digi-Key; ComponentLink4URL: https://datasheet.ciiva.com/6388/71170-6388155.pdf?src-supplier=Digi-Key; ComponentLink4Description: https://datasheet.ciiva.com/6388/71170-6388155.pdf?src-supplier=Digi-Key; ComponentLink5URL: https://datasheet.ciiva.com/11161/71170-11161434.pdf?src-supplier=Avnet; ComponentLink5Description: https://datasheet.ciiva.com/11161/71170-11161434.pdf?src-supplier=Avnet
U13 U14 = DT1240-04LP-7: TVS DIODE 5.5VWM 11VC U-DFN2510; Manufacturer: Diodes; Supplier: Digi-Key; Supplier Part Number: DT1240-04LP-7DICT-ND; Manufacturer Part Number: DT1240-04LP-7; RoHS: Yes; Category: TVS Diodes; Stock: 985; Pricing: 1=0.46, 10=0.319, 100=0.1612, 500=0.1315, 1000=0.09757 (USD); ComponentLink1URL: https://datasheet.ciiva.com/29574/dt1240-04lp-29574117.pdf?src-supplier=Digi-Key; ComponentLink1Description: https://datasheet.ciiva.com/29574/dt1240-04lp-29574117.pdf?src-supplier=Digi-Key; ComponentLink2URL: https://datasheet.ciiva.com/48480/dt1240-04lp-48480037.pdf?src-supplier=Avnet; ComponentLink2Description: https://datasheet.ciiva.com/48480/dt1240-04lp-48480037.pdf?src-supplier=Avnet; ComponentLink3URL: https://datasheet.ciiva.com/29574/dt1240-04lp-29574118.pdf?src-supplier=Digi-Key; ComponentLink3Description: https://datasheet.ciiva.com/29574/dt1240-04lp-29574118.pdf?src-supplier=Digi-Key; ComponentLink4URL: https://datasheet.ciiva.com/29574/dt1240-04lp-29574119.pdf?src-supplier=Digi-Key; ComponentLink4Description: https://datasheet.ciiva.com/29574/dt1240-04lp-29574119.pdf?src-supplier=Digi-Key
U15 = MIC94073YMT: HIGH SIDE POWER SWITCHES; Manufacturer: Mirel Inc.; Manufacturer Part Number: MIC94073YMT; Package: 4-UFDFN Exposed Pad, 4-TMLF®; Item Type: Power Switch

## Sheet UART_INTERFACE.SchDoc
size A4; SheetNumber: 9; SheetTotal: 20
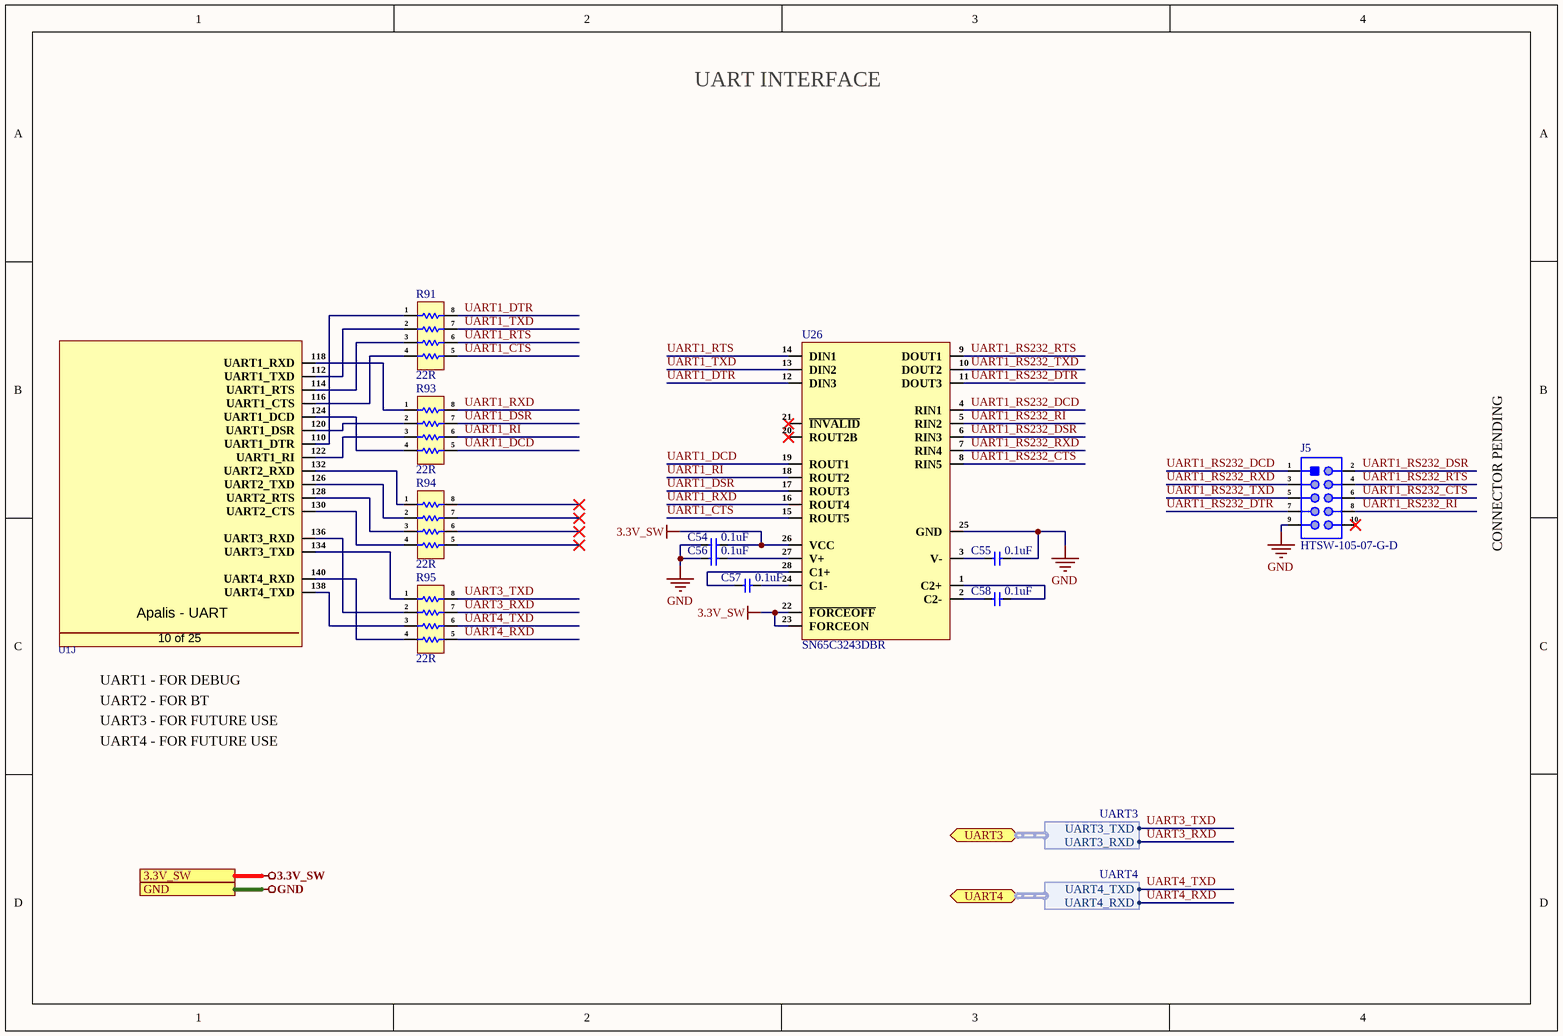
[diagram p8: UART_INTERFACE.SchDoc]

### Parts
C54  0.1uF  [Cap-0402]
C55  0.1uF  [Cap-0402]
C56  0.1uF  [Cap-0402]
C57  0.1uF  [Cap-0402]
C58  0.1uF  [Cap-0402]
J5  HTSW-105-07-G-D  [HTSW-105-07-G-D]
R91  22R  [YC164-JR-0722RL]
R93  22R  [YC164-JR-0722RL]
R94  22R  [YC164-JR-0722RL]
R95  22R  [YC164-JR-0722RL]
U1  MM70-314B1-2-R300  [MM70-314B1-2-R300]  (value not drawn)  (part J of 25)
U26  SN65C3243DBR  [SSOP-28-208mil]

### Ports
3.3V_SW (see Top_Sheet[1D], DIGITAL_I-O_O-P[1D], ETHERNET_INTERFACE[1D], FUTURE_USE_CONNECTOR[1D], HDMI_INTERFACE[1D], I2C_INTERFACE[1B], MICRO_SD_CARD_INTERFACE[1D]), GND (see Top_Sheet[1D], 03-CAN2_SPI_CAN_CONTROLLER[1D], APALIS_POWER_SUPPLY[1D], CAN2_SPI_CAN_CONTROLLER[1D], CODEC_INTERFACE[1D], CONNECTORS[1D], DC_DC_CONVERTER[1D], DIGITAL_I-O_O-P[1D], ETHERNET_INTERFACE[1D], FUTURE_USE_CONNECTOR[1D], GPIO_NC_INTERFACE[4B], HDMI_INTERFACE[1D], I2C_INTERFACE[1B], INPUT_SUPPLY_PROTECTION[1D], LTE_MODULE[1D], MECHANICAL_FOR_PCB[1D], MICRO_SD_CARD_INTERFACE[1D], Reset_and_SDIO[1D], USB3.0_INTERFACE[1D]), UART3 (bidir, harness UART3, see Top_Sheet[1D], FUTURE_USE_CONNECTOR[2D]), UART4 (bidir, harness UART4, see Top_Sheet[1D], FUTURE_USE_CONNECTOR[2D])

### Harnesses
UART3: UART3_TXD, UART3_RXD
UART4: UART4_TXD, UART4_RXD

### Nets
3.3V_SW: C54.2 U26.22(~{FORCEOFF}) U26.23(FORCEON) U26.26(VCC) ; port 3.3V_SW
GND: C54.1 C55.2 C56.1 J5.9 U26.25(GND) ; port GND
UART1_CTS: R91.5 U26.15(ROUT5)
UART1_DCD: R93.5 U26.19(ROUT1)
UART1_DSR: R93.7 U26.17(ROUT3)
UART1_DTR: R91.8 U26.12(DIN3)
UART1_RI: R93.6 U26.18(ROUT2)
UART1_RS232_CTS: J5.6 U26.8(RIN5)
UART1_RS232_DCD: J5.1 U26.4(RIN1)
UART1_RS232_DSR: J5.2 U26.6(RIN3)
UART1_RS232_DTR: J5.7 U26.11(DOUT3)
UART1_RS232_RI: J5.8 U26.5(RIN2)
UART1_RS232_RTS: J5.4 U26.9(DOUT1)
UART1_RS232_RXD: J5.3 U26.7(RIN4)
UART1_RS232_TXD: J5.5 U26.10(DOUT2)
UART1_RTS: R91.6 U26.14(DIN1)
UART1_RXD: R93.8 U26.16(ROUT4)
UART1_TXD: R91.7 U26.13(DIN2)
UART3_RXD: R95.7 ; port UART3.UART3_RXD  [project net UART3.UART3_RXD]
UART3_TXD: R95.8 ; port UART3.UART3_TXD  [project net UART3.UART3_TXD]
UART4_RXD: R95.5 ; port UART4.UART4_RXD  [project net UART4.UART4_RXD]
UART4_TXD: R95.6 ; port UART4.UART4_TXD  [project net UART4.UART4_TXD]
NetC55_1: C55.1 U26.3(V-)
NetC56_2: C56.2 U26.27(V+)
NetC57_1: C57.1 U26.28(C1+)
NetC57_2: C57.2 U26.24(C1-)
NetC58_1: C58.1 U26.2(C2-)
NetC58_2: C58.2 U26.1(C2+)
NetR91_1: R91.1 U1.110(UART1_DTR)
NetR91_2: R91.2 U1.112(UART1_TXD)
NetR91_3: R91.3 U1.114(UART1_RTS)
NetR91_4: R91.4 U1.116(UART1_CTS)
NetR93_1: R93.1 U1.118(UART1_RXD)
NetR93_2: R93.2 U1.120(UART1_DSR)
NetR93_3: R93.3 U1.122(UART1_RI)
NetR93_4: R93.4 U1.124(UART1_DCD)
NetR94_1: R94.1 U1.132(UART2_RXD)
NetR94_2: R94.2 U1.126(UART2_TXD)
NetR94_3: R94.3 U1.128(UART2_RTS)
NetR94_4: R94.4 U1.130(UART2_CTS)
NetR95_1: R95.1 U1.134(UART3_TXD)
NetR95_2: R95.2 U1.136(UART3_RXD)
NetR95_3: R95.3 U1.138(UART4_TXD)
NetR95_4: R95.4 U1.140(UART4_RXD)

Not connected (* = marked no-connect by the designer): J5 10*; R94 5* 6* 7* 8*; U26 20(ROUT2B)* 21(~{INVALID})*

### Notes on the sheet
- UART INTERFACE
- CONNECTOR PENDING
- UART1 - FOR DEBUG
- UART2 - FOR BT
- UART3 - FOR FUTURE USE
- UART4 - FOR FUTURE USE
- (in symbol MM70-314B1-2-R300, part J) Apalis - UART; 10 of 25

### Library data of the parts
C54-C58 = C0402C104K4REC7867: as C7 on sheet APALIS_POWER_SUPPLY; Supplier: Digi-Key; Supplier Part Number: 399-C0402C104K4REC7867CT-ND; Manufacturer Part Number: C0402C104K4REC7867; RoHS: No; Category: Ceramic Capacitors; Stock: 10918; Pricing: 1=0.1, 10=0.072, 50=0.0408, 100=0.0338, 500=0.02372, 1000=0.01963, 2500=0.01827, 5000=0.01672 (USD)
J5 = HTSW-105-07-G-D: CONN HEADER VERT 10POS 2.54MM; Manufacturer: Samtec; Supplier: Rs; Supplier Part Number: 1592350; Manufacturer Part Number: HTSW-105-07-G-D; RoHS: Yes; Category: Connectors; Stock: 16; Pricing: 1=1.3, 25=1.16, 50=1.09, 100=1, 500=0.81 (GBP); ComponentLink1URL: https://datasheet.ciiva.com/737/htsw-xxx-xx-xxx-x-xx-xx-xx-mkt-737898.pdf?src-supplier=Digi-Key; ComponentLink1Description: https://datasheet.ciiva.com/737/htsw-xxx-xx-xxx-x-xx-xx-xx-mkt-737898.pdf?src-supplier=Digi-Key; ComponentLink2URL: https://datasheet.ciiva.com/15195/getdatasheetpartid-252145-15195445.pdf?src-supplier=Verical; ComponentLink2Description: https://datasheet.ciiva.com/15195/getdatasheetpartid-252145-15195445.pdf?src-supplier=Verical
R91 R93-R95 = YC164-JR-0722RL: as R90 on sheet HDMI_INTERFACE; Supplier: Future Electronics; Supplier Part Number: 4472155; Manufacturer Part Number: YC164-JR-0722RL; RoHS: Yes; Category: Resistor Arrays; Stock: 225000; Pricing: 5000=0.0084, 20000=0.008, 50000=0.0078, 125000=0.0075, 200000=0.0071 (USD); ComponentLink1URL: https://datasheet.ciiva.com/8018/443424-8018007.pdf?src-supplier=Element14; ComponentLink1Description: https://datasheet.ciiva.com/8018/443424-8018007.pdf?src-supplier=Element14; ComponentLink2URL: https://datasheet.ciiva.com/8018/443424-8018008.pdf?src-supplier=Element14; ComponentLink2Description: https://datasheet.ciiva.com/8018/443424-8018008.pdf?src-supplier=Element14; ComponentLink3URL: https://datasheet.ciiva.com/2688/pyu-yc-tc164-51-rohs-l-3-2688422.pdf?src-supplier=Digi-Key; ComponentLink3Description: https://datasheet.ciiva.com/2688/pyu-yc-tc164-51-rohs-l-3-2688422.pdf?src-supplier=Digi-Key; ComponentLink4URL: https://datasheet.ciiva.com/2688/pyu-yc-tc164-51-rohs-l-3-2688421.pdf?src-supplier=Digi-Key; ComponentLink4Description: https://datasheet.ciiva.com/2688/pyu-yc-tc164-51-rohs-l-3-2688421.pdf?src-supplier=Digi-Key; ComponentLink5URL: https://datasheet.ciiva.com/8320/pyu-yc-tc164-51-rohs-l-3-8320230.pdf?src-supplier=Avnet; ComponentLink5Description: https://datasheet.ciiva.com/8320/pyu-yc-tc164-51-rohs-l-3-8320230.pdf?src-supplier=Avnet; ComponentLink6URL: https://datasheet.ciiva.com/2688/pyu-yc-tc164-51-rohs-l-3-2688423.pdf?src-supplier=Digi-Key; ComponentLink6Description: https://datasheet.ciiva.com/2688/pyu-yc-tc164-51-rohs-l-3-2688423.pdf?src-supplier=Digi-Key; ComponentLink7URL: https://datasheet.ciiva.com/17030/pyu-yc-tc164-51-rohs-l-3-17030158.pdf?src-supplier=Future+Electronics; ComponentLink7Description: https://datasheet.ciiva.com/17030/pyu-yc-tc164-51-rohs-l-3-17030158.pdf?src-supplier=Future+Electronics; ComponentLink8URL: https://datasheet.ciiva.com/28379/pyu-yc-tc164-51-rohs-l-3-28379358.pdf?; ComponentLink8Description: https://datasheet.ciiva.com/28379/pyu-yc-tc164-51-rohs-l-3-28379358.pdf?
U1 = MM70-314B1-2-R300: as U1 on sheet APALIS_POWER_SUPPLY; Supplier: Digi-Key; Supplier Part Number: 670-MM70-314B1-2-R300CT-ND; Manufacturer Part Number: MM70-314B1-2-R300; RoHS: No; Category: Card Edge Connectors; Stock: 4979; Pricing: 1=9.21, 10=8.287, 25=7.8064, 50=7.6064, 100=7.4062 (USD)
U26 = SN65C3243DBR: RCLAMP Series 16 Vcl 0.4 pF RailClamp® TVS Diode Array - SLP-1616P6; Manufacturer: Texas Instruments; Direction: Unidirectional; Value: 0.4pF; Number of Channels: 4; Number of Elements: 1; Reverse Standoff Voltage: 3.3V; Min Breakdown Voltage: 3.5V; Clamping Voltage: 16V; Peak Pulse Power: 80W; Power Line Protection: Yes; Leakage Current: 500nA; Peak Pulse Current: 5A; Supplier: Mouser; Supplier Part Number: 595-SN65C3243DBR; Manufacturer Part Number: SN65C3243DBR; RoHS: Yes; Category: Interface ICs; Stock: 5977; Pricing: 1=3.6, 10=3.17, 50=3.17, 100=2.65, 1000=1.9, 10000=1.71 (USD); ComponentLink1URL: https://datasheet.ciiva.com/41461/001186900-da-01-en-ic-line-drvr-rc-sn65c3243dbr-ssop-28-tid-41461426.pdf?src-supplier=Conrad; ComponentLink1Description: https://datasheet.ciiva.com/41461/001186900-da-01-en-ic-line-drvr-rc-sn65c3243dbr-ssop-28-tid-41461426.pdf?src-supplier=Conrad; ComponentLink2URL: https://datasheet.ciiva.com/15151/getdatasheetpartid-129898-15151437.pdf?src-supplier=Verical; ComponentLink2Description: https://datasheet.ciiva.com/15151/getdatasheetpartid-129898-15151437.pdf?src-supplier=Verical; ComponentLink3URL: https://datasheet.ciiva.com/1704/sn65c3243-1704841.pdf?src-supplier=Digi-Key; ComponentLink3Description: https://datasheet.ciiva.com/1704/sn65c3243-1704841.pdf?src-supplier=Digi-Key; ComponentLink4URL: https://datasheet.ciiva.com/1704/sn65c3243-1704842.pdf?src-supplier=Digi-Key; ComponentLink4Description: https://datasheet.ciiva.com/1704/sn65c3243-1704842.pdf?src-supplier=Digi-Key; ComponentLink5URL: https://datasheet.ciiva.com/1704/sn65c3243-1704843.pdf?src-supplier=Digi-Key; ComponentLink5Description: https://datasheet.ciiva.com/1704/sn65c3243-1704843.pdf?src-supplier=Digi-Key; Mounting Technology: Surface Mount; Case/Package: QFN; Pins: 6; Min Operating Temperature: -55°C; Max Operating Temperature: 125°C; Packaging: Tape and Reel; Working Voltage: 3.3V; Polarity: Unidirectional; Operating Supply Voltage: 3.3V; Series: RailClamp®; Clamping Voltage-Max: 16V; Number of Unidirectional Channels: 4; Length: 1.6mm; Depth: 1.6mm; Radiation Hardening: No; Lead Free: Lead Free; RoHS Compliant: Yes; ComponentLink6URL: https://datasheet.ciiva.com/16480/rclamp2504p-tct-16480613.pdf?src-supplier=Future+Electronics; ComponentLink6Description: https://datasheet.ciiva.com/16480/rclamp2504p-tct-16480613.pdf?src-supplier=Future+Electronics; ComponentLink7URL: https://datasheet.ciiva.com/18065/getdatasheetpartid-146086-18065702.pdf?src-supplier=Verical; ComponentLink7Description: https://datasheet.ciiva.com/18065/getdatasheetpartid-146086-18065702.pdf?src-supplier=Verical; ComponentLink8URL: https://datasheet.ciiva.com/338/rclamp2504p-rclamp3304p-338729.pdf?src-supplier=Digi-Key; ComponentLink8Description: https://datasheet.ciiva.com/338/rclamp2504p-rclamp3304p-338729.pdf?src-supplier=Digi-Key; ComponentLink9URL: https://datasheet.ciiva.com/338/rclamp2504p-rclamp3304p-338730.pdf?src-supplier=Digi-Key; ComponentLink9Description: https://datasheet.ciiva.com/338/rclamp2504p-rclamp3304p-338730.pdf?src-supplier=Digi-Key; ComponentLink10URL: https://datasheet.ciiva.com/338/rclamp2504p-rclamp3304p-338728.pdf?src-supplier=Digi-Key; ComponentLink10Description: https://datasheet.ciiva.com/338/rclamp2504p-rclamp3304p-338728.pdf?src-supplier=Digi-Key; ComponentLink11URL: https://datasheet.ciiva.com/11193/rclamp2504p-rclamp3304p-11193626.pdf?src-supplier=Avnet; ComponentLink11Description: https://datasheet.ciiva.com/11193/rclamp2504p-rclamp3304p-11193626.pdf?src-supplier=Avnet